# Altium schematic sheet AudioAmplifier.SchDoc
size A; SheetNumber: 6; SheetTotal: 6
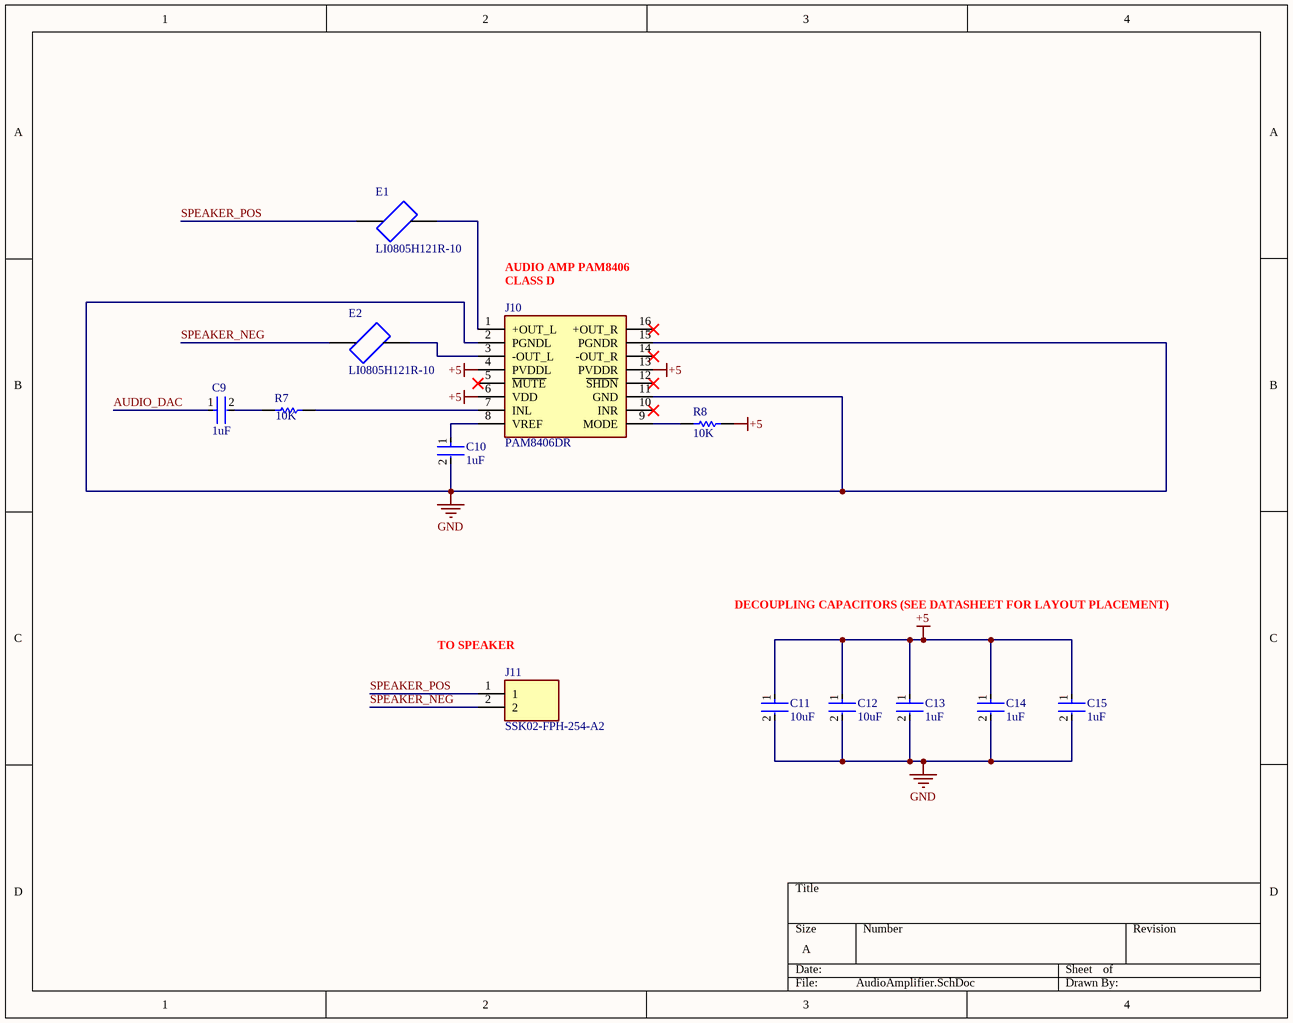
[diagram p0: AudioAmplifier.SchDoc]

## Parts
C9  1uF  [FP-RHE1DB-MFG]
C10  1uF  [FP-RHE1DB-MFG]
C11  10uF  [FP-RHE1DB-MFG]
C12  10uF  [FP-RHE1DB-MFG]
C13  1uF  [FP-RHE1DB-MFG]
C14  1uF  [FP-RHE1DB-MFG]
C15  1uF  [FP-RHE1DB-MFG]
E1  LI0805H121R-10  [FB_LI0805H121R-10]
E2  LI0805H121R-10  [FB_LI0805H121R-10]
J10  PAM8406DR  [SOIC127P600X126-16N]
J11  SSK02-FPH-254-A2  [SAMESKY_SSK02-FPH-254-A2]
R7  10K  [RESA60-630X240]
R8  10K  [RESA60-630X240]

## Nets
+5: C11.1 C12.1 C13.1 C14.1 C15.1 J10.4(PVDDL) J10.6(VDD) J10.13(PVDDR) R8.1
GND: C10.2 C11.2 C12.2 C13.2 C14.2 C15.2 J10.2(PGNDL) J10.11(GND) J10.15(PGNDR)
AUDIO_DAC: C9.1
SPEAKER_NEG: E2.1 J11.2
SPEAKER_POS: E1.1 J11.1
NetC9_2: C9.2 R7.2
NetC10_1: C10.1 J10.8(VREF)
NetE1_2: E1.2 J10.1(+OUT_L)
NetE2_2: E2.2 J10.3(-OUT_L)
NetJ10_7: J10.7(INL) R7.1
NetJ10_9: J10.9(MODE) R8.2

Not connected (* = marked no-connect by the designer): J10 5(~{MUTE})* 10(INR)* 12(~{SHDN})* 14(-OUT_R)* 16(+OUT_R)*

## Notes on the sheet
- AUDIO AMP PAM8406
- (near J10) CLASS D
- DECOUPLING CAPACITORS (SEE DATASHEET FOR LAYOUT PLACEMENT)
- (near J11) TO SPEAKER

## Library data of the parts
C9-C15 = CMP-06035-012170-1: Ceramic Capacitor Automotive 330nF ±10% 50V X8L Radial; Tolerance: 10%; Lead Pitch: 2.5mm; Capacitance: 330nF; Max Operating Temperature: 150°C; Dielectric: X8L; Voltage Rating: 50V; Voltage Rating (DC): 50V; Min Operating Temperature: -55°C; REACH SVHC: No SVHC
E1 E2 = LI0805H121R-10: EMI Ferrite Chip Bead, 0805, 800MA, 120Ohms @100MHz, DCR Max 0.150Ohm | Laird Performance Materials LI0805H121R-10; SnapEDA_Link: https://www.snapeda.com/parts/LI0805H121R-10/Laird/view-part/?ref=snap; Package: 0805 Laird; Value: *; MF: Laird; MP: LI0805H121R-10; Check_prices: https://www.snapeda.com/parts/LI0805H121R-10/Laird/view-part/?ref=eda
J10 = PAM8406DR: DiodesZetex PAM8406DR 2-Channel Audio Amplifier, Class-AB, Class-D Stereo, 16-Pin SOP; Manufacturer_Name: Diodes Incorporated; Geometry.Height: 1.26mm; Manufacturer_Part_Number: PAM8406DR; Mouser Part Number: 621-PAM8406DR; Mouser Price/Stock: https://www.mouser.co.uk/ProductDetail/Diodes-Incorporated/PAM8406DR?qs=%252BSlWJf1dfkLK5VNh%252Bez%2F0Q%3D%3D; Arrow Part Number: PAM8406DR; Arrow Price/Stock: https://www.arrow.com/en/products/pam8406dr/diodes-incorporated?utm_currency=USD&region=asia; Datasheet Link: https://www.diodes.com//assets/Datasheets/PAM8406.pdf
J11 = SSK02-FPH-254-A2: 2 Position Header Connector 0.100 (2.54mm) Through Hole Gold; MF: Same Sky (Formerly CUI Devices); SnapEDA_Link: https://www.snapeda.com/parts/SSK02-FPH-254-A2/Same+Sky/view-part/?ref=snap; Package: None; Value: *; MP: SSK02-FPH-254-A2; Check_prices: https://www.snapeda.com/parts/SSK02-FPH-254-A2/Same+Sky/view-part/?ref=eda
R7 R8 = CMP-1659-00070-1: Axial Resistor, 1 MOhm, +/- 1%, 250 mW, -55 to 155 degC, 2-Pin THD, RoHS, Bulk; Power Rating: 250 mW; Resistance: 47.5 kohm; Voltage Rating: 250 V; ComponentLink1Description: Manufacturer URL; PackageReference: MFR-25; ComponentLink2Description: Datasheet; ComponentLink2URL: http://www.yageo.com/documents/recent/Yageo%20LR_MFR_2013.pdf; Tolerance: 1%; DatasheetVersion: Apr-13; Package Quantity: 200; Packaging: Bulk; Case\Package: Axial; RoHSCompliant: true; ComponentLink1URL: http://www.yageo.com/; Length: 0.248 inch; Min Operating Temperature: -55 degC; Mount: Through Hole; PackageDescription: 2-Pin Axial Lead, Dia 2.4 mm, Body Length 6.3 mm; Max Operating Temperature: 155 degC